# Altium schematic sheet Peripheral_Section.SchDoc
size A4
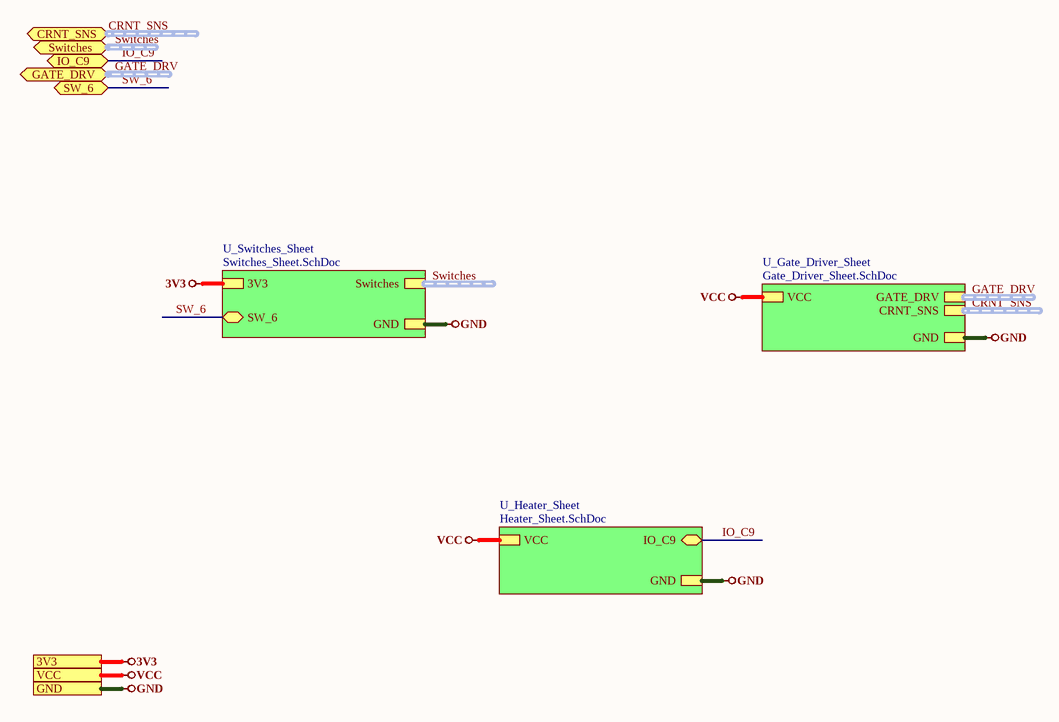
[diagram p0: Peripheral_Section.SchDoc]

## Sub-sheets
U_Gate_Driver_Sheet = Gate_Driver_Sheet.SchDoc: GATE_DRV (harness GATE_DRV), VCC, GND, CRNT_SNS (harness CRNT_SNS)
U_Heater_Sheet = Heater_Sheet.SchDoc: IO_C9 (bidir), VCC, GND
U_Switches_Sheet = Switches_Sheet.SchDoc: Switches (harness Switches), SW_6 (bidir), GND, 3V3

## Ports
3V3, CRNT_SNS (bidir, harness CRNT_SNS), GATE_DRV (bidir, harness GATE_DRV), GND, IO_C9 (bidir), SW_6 (bidir), Switches (bidir, harness Switches), VCC

## Nets
3V3: port 3V3, sheet U_Switches_Sheet/3V3
GND: port GND, sheet U_Switches_Sheet/GND, sheet U_Gate_Driver_Sheet/GND, sheet U_Heater_Sheet/GND
VCC: port VCC, sheet U_Gate_Driver_Sheet/VCC, sheet U_Heater_Sheet/VCC
IO_C9: port IO_C9, sheet U_Heater_Sheet/IO_C9
SW_6: port SW_6, sheet U_Switches_Sheet/SW_6

## Buses and harness runs
harness CRNT_SNS = port CRNT_SNS
harness CRNT_SNS = sheet U_Gate_Driver_Sheet/CRNT_SNS
harness GATE_DRV = port GATE_DRV
harness GATE_DRV = sheet U_Gate_Driver_Sheet/GATE_DRV
harness Switches = port Switches
harness Switches = sheet U_Switches_Sheet/Switches